# Altium project Fairing_Avionics_Interface.PrjPcb (part 2 of 2)

## Sheet STM32.SchDoc
size 558 x 431 mm; SheetNumber: 5; SheetTotal: 6; SPICEModelCachePHPYDYLM: <root> / <DocumentId>PHPYDYLM</DocumentId> / </root>
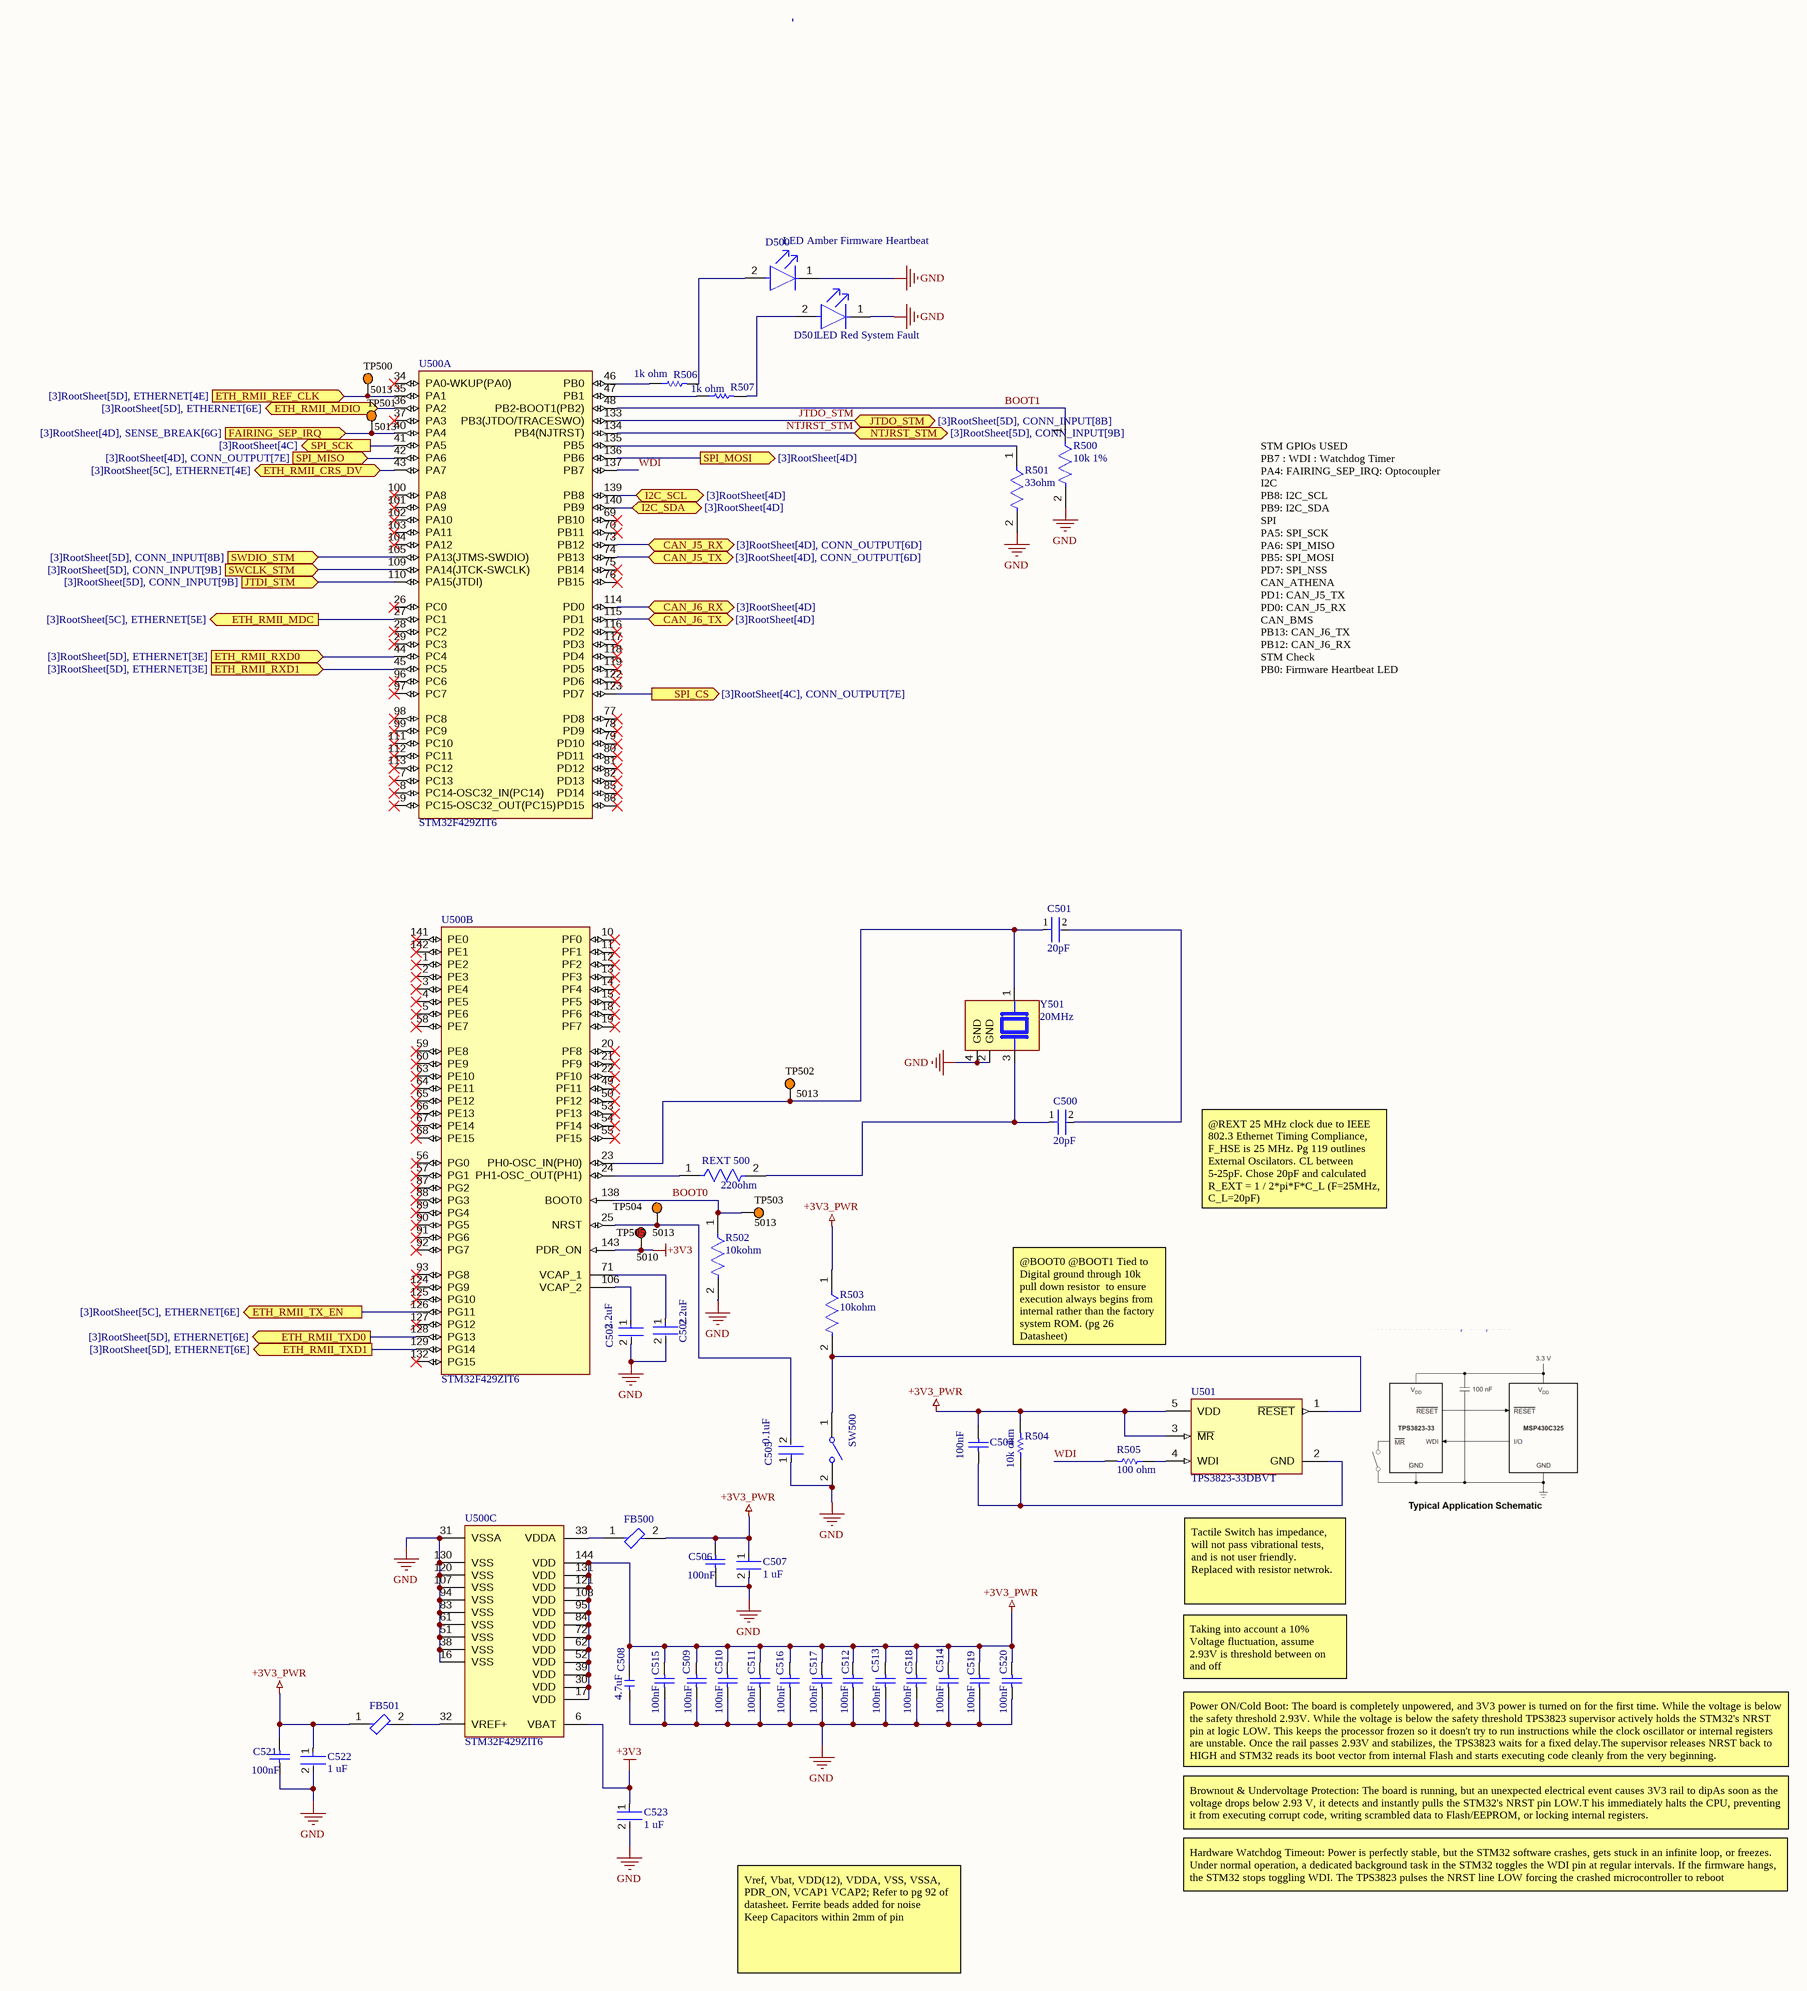
[diagram p3: STM32.SchDoc]

### Parts
C500  20pF  [FP-GJM033-0_03P-MFG]
C501  20pF  [FP-GJM033-0_03P-MFG]
C502  2.2uF  [FP-CC0603-DC-MFG]
C503  2.2uF  [FP-CC0603-DC-MFG]
C504  100nF  [CAPC1608X90X35ML10T15]
C505  0.1uF  [FP-GCM188-0_1-IPC_A]
C506  100nF  [CAPC0603(1608)100_L]
C507  1 uF  [FP-GRM15-0_1-MFG]
C508  4.7uF  [C0603]
C509  100nF  [CAPC0603(1608)100_L]
C510  100nF  [CAPC0603(1608)100_L]
C511  100nF  [CAPC0603(1608)100_L]
C512  100nF  [CAPC0603(1608)100_L]
C513  100nF  [CAPC0603(1608)100_L]
C514  100nF  [CAPC0603(1608)100_L]
C515  100nF  [CAPC0603(1608)100_L]
C516  100nF  [CAPC0603(1608)100_L]
C517  100nF  [CAPC0603(1608)100_L]
C518  100nF  [CAPC0603(1608)100_L]
C519  100nF  [CAPC0603(1608)100_L]
C520  100nF  [CAPC0603(1608)100_L]
C521  100nF  [CAPC0603(1608)100_L]
C522  1 uF  [FP-GRM15-0_1-MFG]
C523  1 uF  [FP-GRM15-0_1-MFG]
D500  LED Amber Firmware Heartbeat  [FP-SML-D12-MFG]
D501  LED Red System Fault  [FP-SML-P1-MFG]
FB500  BLM18PG121SN1D  [FP-BLM18-0_15-t0_8-IPC_A]  (value not drawn)
FB501  BLM18PG121SN1D  [FP-BLM18-0_15-t0_8-IPC_A]  (value not drawn)
R500  10k 1%  [FP-RC0603-0_55-IPC_C]
R501  33ohm  [FP-CRCW0603-e3-IPC_A]
R502  10kohm  [FP-RC0603-0_55-IPC_C]
R503  10kohm  [FP-RC0603-0_55-IPC_C]
R504  10k ohm  [RESC1609X50X30ML8T20]
R505  100 ohm  [RESC1609X50X30ML8T20]
R506  1k ohm  [RESC2010(5025)_L]
R507  1k ohm  [RESC2010(5025)_L]
REXT_500  220ohm  [FP-CRCW0603-e3-MFG]
SW500  434121050836  [434121050836]  (value not drawn)
TP500  5013  [KSTN-5013_V]
TP501  5013  [KSTN-5013_V]
TP502  5013  [KSTN-5013_V]
TP503  5013  [KSTN-5013_V]
TP504  5013  [KSTN-5013_V]
TP505  5010  [KSTN-5010_V]
U500  STM32F429ZIT6  [STM-LQFP144_L]  (parts A,B,C of 3)
U501  TPS3823-33DBVT  [FP-DBV0005A-MFG]
Y501  20MHz  [XTAL_C1E-20.000-6-3030-X-R]

### Ports
CAN_J5_RX (bidir, see [3]RootSheet[4D], CONN_OUTPUT[6D]), CAN_J5_TX (bidir, see [3]RootSheet[4D], CONN_OUTPUT[6D]), CAN_J6_RX (bidir, see [3]RootSheet[4D]), CAN_J6_TX (bidir, see [3]RootSheet[4D]), ETH_RMII_CRS_DV (bidir, see [3]RootSheet[5C], ETHERNET[4E]), ETH_RMII_MDC (out, see [3]RootSheet[5C], ETHERNET[5E]), ETH_RMII_MDIO (bidir, see [3]RootSheet[5D], ETHERNET[6E]), ETH_RMII_REF_CLK (in, see [3]RootSheet[5D], ETHERNET[4E]), ETH_RMII_RXD0 (in, see [3]RootSheet[5D], ETHERNET[3E]), ETH_RMII_RXD1 (in, see [3]RootSheet[5D], ETHERNET[3E]), ETH_RMII_TX_EN (out, see [3]RootSheet[5C], ETHERNET[6E]), ETH_RMII_TXD0 (out, see [3]RootSheet[5D], ETHERNET[6E]), ETH_RMII_TXD1 (out, see [3]RootSheet[5D], ETHERNET[6E]), FAIRING_SEP_IRQ (in, see [3]RootSheet[4D], SENSE_BREAK[6G]), I2C_SCL (bidir, see [3]RootSheet[4D]), I2C_SDA (bidir, see [3]RootSheet[4D]), JTDI_STM (in, see [3]RootSheet[5D], CONN_INPUT[9B]), JTDO_STM (bidir, see [3]RootSheet[5D], CONN_INPUT[8B]), NTJRST_STM (bidir, see [3]RootSheet[5D], CONN_INPUT[9B]), SPI_CS (out, see [3]RootSheet[4C], CONN_OUTPUT[7E]), SPI_MISO (in, see [3]RootSheet[4D], CONN_OUTPUT[7E]), SPI_MOSI (out, see [3]RootSheet[4D]), SPI_SCK (out, see [3]RootSheet[4C]), SWCLK_STM (in, see [3]RootSheet[5D], CONN_INPUT[9B]), SWDIO_STM (in, see [3]RootSheet[5D], CONN_INPUT[8B])

### Nets
+3V3: C523.1 TP505.1 U500.6(VBAT) U500.143(PDR_ON)
+3V3_PWR: C504.2 C506.2 C507.1 C508.2 C509.2 C510.2 C511.2 C512.2 C513.2 C514.2 C515.2 C516.2 C517.2 C518.2 C519.2 C520.2 C521.2 C522.1 FB500.2 FB501.1 R503.1 R504.2 U500.17(VDD) U500.30(VDD) U500.39(VDD) U500.52(VDD) U500.62(VDD) U500.72(VDD) U500.84(VDD) U500.95(VDD) U500.108(VDD) U500.121(VDD) U500.131(VDD) U500.144(VDD) U501.3(~{MR}) U501.5(VDD)
GND: C502.2 C503.2 C505.1 C506.1 C507.2 C508.1 C509.1 C510.1 C511.1 C512.1 C513.1 C514.1 C515.1 C516.1 C517.1 C518.1 C519.1 C520.1 C521.1 C522.2 C523.2 D500.1(C) D501.1(C) R500.2 R501.2 R502.2 SW500.2 U500.16(VSS) U500.31(VSSA) U500.38(VSS) U500.51(VSS) U500.61(VSS) U500.83(VSS) U500.94(VSS) U500.107(VSS) U500.120(VSS) U500.130(VSS) Y501.2(GND) Y501.4(GND)
BOOT0: R502.1 TP503.1 U500.138(BOOT0)
BOOT1: R500.1 U500.48(PB2-BOOT1(PB2))
I2C_SCL: U500.140(PB9) ; port I2C_SDA
I2C_SDA: U500.139(PB8) ; port I2C_SCL
JTDO_STM: U500.133(PB3(JTDO/TRACESWO)) ; port JTDO_STM
NTJRST_STM: U500.134(PB4(NJTRST)) ; port NTJRST_STM
WDI: R505.2 U500.137(PB7)
NetC400_2: TP501.1 U500.40(PA4) ; port FAIRING_SEP_IRQ
NetC500_1: C500.1 REXT_500.2 Y501.3
NetC500_2: C500.2 C501.2
NetC501_1: C501.1 TP502.1 U500.23(PH0-OSC_IN(PH0)) Y501.1
NetC502_1: C502.1 U500.71(VCAP_1)
NetC503_1: C503.1 U500.106(VCAP_2)
NetC504_1: C504.1 R504.1 U501.2(GND)
NetC505_2: C505.2 TP504.1 U500.25(NRST)
NetD500_2: D500.2(A) R506.2
NetD501_2: D501.2(A) R507.2
NetFB500_1: FB500.1 U500.33(VDDA)
NetFB501_2: FB501.2 U500.32(VREF+)
NetJ9_2: U500.105(PA13(JTMS-SWDIO)) ; port SWDIO_STM
NetJ9_3: U500.110(PA15(JTDI)) ; port JTDI_STM
NetJ9_5: U500.109(PA14(JTCK-SWCLK)) ; port SWCLK_STM
NetR302_1: U500.126(PG11) ; port ETH_RMII_TX_EN
NetR304_2: U500.44(PC4) ; port ETH_RMII_RXD0
NetR305_1: U500.128(PG13) ; port ETH_RMII_TXD0
NetR306_2: U500.45(PC5) ; port ETH_RMII_RXD1
NetR307_1: U500.129(PG14) ; port ETH_RMII_TXD1
NetR308_1: U500.43(PA7) ; port ETH_RMII_CRS_DV
NetR309_1: U500.36(PA2) ; port ETH_RMII_MDIO
NetR501_1: R501.1 U500.135(PB5)
NetR503_2: R503.2 SW500.1 U501.1(~{RESET})
NetR505_1: R505.1 U501.4(WDI)
NetR506_1: R506.1 U500.46(PB0)
NetR507_1: R507.1 U500.47(PB1)
NetR602_1: U500.136(PB6) ; port SPI_MOSI
NetR603_1: U500.42(PA6) ; port SPI_MISO
NetR604_1: U500.41(PA5) ; port SPI_SCK
NetR605_1: U500.123(PD7) ; port SPI_CS
NetREXT_500_1: REXT_500.1 U500.24(PH1-OSC_OUT(PH1))
NetTP500_1: TP500.1 U500.35(PA1) ; port ETH_RMII_REF_CLK
NetU300_11: U500.27(PC1) ; port ETH_RMII_MDC
NetU500_73: U500.73(PB12) ; port CAN_J5_RX
NetU500_74: U500.74(PB13) ; port CAN_J5_TX
NetU500_114: U500.114(PD0) ; port CAN_J6_RX
NetU500_115: U500.115(PD1) ; port CAN_J6_TX

Not connected (* = marked no-connect by the designer): U500 1(PE2)* 2(PE3)* 3(PE4)* 4(PE5)* 5(PE6)* 7(PC13)* 8(PC14-OSC32_IN(PC14))* 9(PC15-OSC32_OUT(PC15))* 10(PF0)* 11(PF1)* 12(PF2)* 13(PF3)* 14(PF4)* 15(PF5)* 18(PF6)* 19(PF7)* 20(PF8)* 21(PF9)* 22(PF10)* 26(PC0)* 28(PC2)* 29(PC3)* 34(PA0-WKUP(PA0))* 37(PA3)* 49(PF11)* 50(PF12)* 53(PF13)* 54(PF14)* 55(PF15)* 56(PG0)* 57(PG1)* 58(PE7)* 59(PE8)* 60(PE9)* 63(PE10)* 64(PE11)* 65(PE12)* 66(PE13)* 67(PE14)* 68(PE15)* 69(PB10)* 70(PB11)* 75(PB14)* 76(PB15)* 77(PD8)* 78(PD9)* 79(PD10)* 80(PD11)* 81(PD12)* 82(PD13)* 85(PD14)* 86(PD15)* 87(PG2)* 88(PG3)* 89(PG4)* 90(PG5)* 91(PG6)* 92(PG7)* 93(PG8)* 96(PC6)* 97(PC7)* 98(PC8)* 99(PC9)* 100(PA8)* 101(PA9)* 102(PA10)* 103(PA11)* 104(PA12)* 111(PC10)* 112(PC11)* 113(PC12)* 116(PD2)* 117(PD3)* 118(PD4)* 119(PD5)* 122(PD6)* 124(PG9)* 125(PG10)* 127(PG12)* 132(PG15)* 141(PE0)* 142(PE1)*

### Notes on the sheet
- STM GPIOs USED
  PB7 : WDI : Watchdog Timer
  PA4: FAIRING_SEP_IRQ: Optocoupler
  I2C
  PB8: I2C_SCL
  PB9: I2C_SDA
  SPI
  PA5: SPI_SCK
  PA6: SPI_MISO
  PB5: SPI_MOSI
  PD7: SPI_NSS
  CAN_ATHENA
  PD1: CAN_J5_TX
  PD0: CAN_J5_RX
  CAN_BMS
  PB13: CAN_J6_TX
  PB12: CAN_J6_RX
  STM Check
  PB0: Firmware Heartbeat LED
- @REXT 25 MHz clock due to IEEE 802.3 Ethernet Timing Compliance, F_HSE is 25 MHz. Pg 119 outlines External Oscilators. CL between 5-25pF. Chose 20pF and calculated R_EXT = 1 / 2*pi*F*C_L (F=25MHz, C_L=20pF)
- @BOOT0 @BOOT1 Tied to Digital ground through 10k pull down resistor  to ensure execution always begins from internal rather than the factory system ROM. (pg 26 Datasheet)
- Tactile Switch has impedance, will not pass vibrational tests, and is not user friendly. Replaced with resistor netwrok.
- Taking into account a 10% Voltage fluctuation, assume 2.93V is threshold between on and off
- Power ON/Cold Boot: The board is completely unpowered, and 3V3 power is turned on for the first time. While the voltage is below the safety threshold 2.93V. While the voltage is below the safety threshold TPS3823 supervisor actively holds the STM32's NRST pin at logic LOW. This keeps the processor frozen so it doesn't try to run instructions while the clock oscillator or internal registers are unstable. Once the rail passes 2.93V and stabilizes, the TPS3823 waits for a fixed delay.The supervisor releases NRST back to HIGH and STM32 reads its boot vector from internal Flash and starts executing code cleanly from the very beginning.
- Brownout & Undervoltage Protection: The board is running, but an unexpected electrical event causes 3V3 rail to dipAs soon as the voltage drops below 2.93 V, it detects and instantly pulls the STM32's NRST pin LOW.T his immediately halts the CPU, preventing it from executing corrupt code, writing scrambled data to Flash/EEPROM, or locking internal registers.
- Hardware Watchdog Timeout: Power is perfectly stable, but the STM32 software crashes, gets stuck in an infinite loop, or freezes. Under normal operation, a dedicated background task in the STM32 toggles the WDI pin at regular intervals. If the firmware hangs, the STM32 stops toggling WDI. The TPS3823 pulses the NRST line LOW forcing the crashed microcontroller to reboot
- Vref, Vbat, VDD(12), VDDA, VSS, VSSA, PDR_ON, VCAP1 VCAP2; Refer to pg 92 of datasheet. Ferrite beads added for noise
  Keep Capacitors within 2mm of pin
- DWG. NO.
- REV.
- SHT.
- REVISION
- DESCRIPTION
- DATE
- APPROVED
- THIS DOCUMENT AND THE DATA DISCLOSED HEREIN OR HEREWITH IS THE PROPERTY OF ALTIUM LIMITED AND MAY BE FREELY DISTRIBUTED IN WHOLE. NO RIGHTS ARE RESERVED OR EXPRESS OR IMPLIED WARANTEE GIVEN.
- ENG:
- DSN:
- APPROVALS
- PROJECT
- DOCUMENT REVISION:
- DESIGN ITEM:
- CHK:
- BOM:
- REFERENCE DOCUMENTS
- PROJECT REVISION:
- TITLE
- FAB DWG:
- PCB DWG:
- ASSY DWG:
- SCALE:
- SIZE
- C
- CAGE CODE
- FILE NAME
- DWG NO.
- SHEET
- OF
- REV

### Library data of the parts
C500 C501 = CMP-00260-148574905-1: GJM0335C2A200GB01D Gjm 0201 C0G 20PF 100V 2%; Voltage Rating (DC): 100V; Case/Package: 0201; NexarPartId: 148574905; Thickness: 300µm; Lifecycle Status: Production; Length: 600µm; Width: 300µm; Capacitance: 20pF
C502 C503 = CMP-03422-000578-2: CAP CER 2.2UF 50V X5R 0603; Tolerance: 10%; Packaging: Cut Tape; Capacitance: 2.2uF; Min Operating Temperature: -55°C; RoHS Compliant: Yes; Max Operating Temperature: 85°C; Case Code (Metric): 1608; Voltage Rating: 50V; Case/Package: 0603; Case Code (Imperial): 0603; Mount: Surface Mount
C504 = CMP-2006-02375-5: Chip Capacitor, 100 nF, +/- 10%, 50 V, -55 to 125 degC, 0603 (1608 Metric), RoHS, Tape and Reel; Manufacturer: Murata; Voltage Rating: 50 V; Min Operating Temperature: -55 degC; ComponentLink1URL: http://www.murata.com/; PackageReference: 0603; Max Operating Temperature: 125 degC; ComponentLink1Description: Manufacturer URL; ComponentLink2Description: Datasheet; Packaging: Tape and Reel; PackageDescription: 2-Pin Surface Mount Device, Body 1.6 x 0.8 mm; Height: 0.8 mm; Mounting Technology: Surface Mount; Mount: Surface Mount; Length: 1.6 mm; ComponentLink2URL: http://psearch.en.murata.com/capacitor/product/GCM188R71H104KA57%23.pdf; Package Quantity: 4000; REACH SVHC: No SVHC; RoHSCompliant: true; DatasheetVersion: 07/2016
C505 = CMP-2006-02355-2: CAP CER 0.1UF 16V X7R 0603; Tolerance: 10%; Capacitance: 100nF; Thickness: 0.035inch; Lead Free: Lead Free; Dielectric: X7R; Case Code (Metric): 1608; Voltage Rating: 16V; Depth: 0.8mm; Height: 0.8mm; RoHS Compliant: Yes; Termination: SMD/SMT; Case/Package: 0603; Case Code (Imperial): 0603; Package Quantity: 4000; Voltage: 16V; Radiation Hardening: No; Series: GCM; Length: 1.6mm; Mount: Surface Mount; Construction: Flat; Ratings: AEC-Q200; Min Operating Temperature: -55°C; Packaging: Tape and Reel; Voltage Rating (DC): 16V; Max Operating Temperature: 125°C; Width: 0.031inch; REACH SVHC: No SVHC
C506 C509-C521 = CMP-1035-02591-1: CAP 100nF 50V ±5% 0603 (1608 Metric) Thickness 1mm SMD; Tolerance: Â±5%; Case-Metric: 1608; Case-EIA: 0603; Rated Voltage: 50 V; Max Thickness: 1 mm; Technology: SMT; Value: 100nF
C507 C522 C523 = CMP-2008-04556-2: CAP CER 1UF 10V X5R 0402; Manufacturer Part Number: GRM155R61A105KE15D; Manufacturer: Murata; Material: Ceramic; Tolerance: 10%; Temperature Coefficient: 15%; Octopart: https://octopart.com/grm155r61a105ke15d-murata-197442; Lead Free: Yes; ComponentLink2Description: Datasheet; Temperature: -55°C to +85°C; Temperature Range High: +85°C; Height: 0.55mm; Capacitance: 1uF; Ipc Land Pattern Name: CAPC10050X50; ComponentLink2URL: https://search.murata.co.jp/Ceramy/image/img/A01X/G101/ENG/GRM155R61A105KE15-01A.pdf; Temperature Range Low: -55°C; Device Class L2: Capacitors; Voltage Rating: 10V; RoHS: TRUE; Device Class L1: Passive Components; Device Class L3: Ceramic Capacitors; Temperature Characteristic: X5R; Mouser Description: 0402 1 uF 10 V ±10% Tolerance X5R Surface Mount Multilayer Ceramic Capacitor; Automotive: No; Package: GRM15-0.1; Digikey Description: CAP CER 1UF 10V X5R 0402; Value: 1uF; Category: Cap
C508 = CERAMIC-4.7UF-10V-10%-X5R(0603): 4.7 ÂµF Â±10% 10V Ceramic Capacitor X5R 0603 (1608 Metric); MF: Yageo; MP: CC0603KRX5R6BB475; SnapEDA_Link: https://www.snapeda.com/parts/CC0603KRX5R6BB475/Yageo/view-part/?ref=snap; Package: 0603 Yageo; Value: *; Check_prices: https://www.snapeda.com/parts/CC0603KRX5R6BB475/Yageo/view-part/?ref=eda
D500 = CMP-08952-000023-1: LED YELLOW DIFFUSED 0603 SMD; Manufacturer: Rohm; Manufacturer Part Number: SML-D12Y8WT86; Forward Voltage: 2.2V; Wavelength: 590nm; Reverse Voltage: 5V; Led Orientation: Top View; Forward Current: 20mA; Power Dissipation: 54mW; Luminous Intensity: 63mcd; Temperature: -40°C to +85°C; Package: SML-D12; Height: 0.65mm; Lead Free: Yes; Octopart: https://octopart.com/sml-d12y8wt86-rohm-8992279; Device Class L3: unset; Category: Diode; Device Class L2: LEDs; Temperature Range Low: -40°C; Colour: Yellow; ComponentLink2URL: https://d1d2qsbl8m0m72.cloudfront.net/en/products/databook/datasheet/opto/led/chip_mono/sml-d12x8_d13x8-e.pdf; Automotive: No; Device Class L1: Optoelectronics; Digikey Description: LED YELLOW DIFFUSED 0603 SMD; Mouser Description: Standard LEDs - SMD SMD Yellow 25-160 mcd; RoHS: TRUE; Temperature Range High: +85°C; ComponentLink2Description: Datasheet
D501 = CMP-08952-000003-1: LED RED CLEAR 1006 SMD; Manufacturer Part Number: SML-P11VTT86R; Manufacturer: Rohm; Led Orientation: Top View; Power Dissipation: 50mW; Wavelength: 626nm; Forward Voltage: 1.8V; Forward Current: 1mA; Luminous Intensity: 4mcd; Reverse Voltage: 5V; ComponentLink2URL: https://www.rohm.com/datasheet/SML-P11VT(R)/sml-p11-e; Temperature: -40°C to +85°C; Device Class L2: LEDs; Package: SML-P1; Category: Diode; Automotive: No; RoHS: TRUE; Lead Free: Yes; Digikey Description: LED RED CLEAR 1006 SMD; Device Class L3: unset; ComponentLink2Description: Datasheet; Octopart: https://octopart.com/sml-p11vtt86r-rohm-34112314; Device Class L1: Optoelectronics; Temperature Range High: +85°C; Temperature Range Low: -40°C; Mouser Description: SML-P11 Series Red 0402 Clear 4 mcd 1.8 V Surface Mount PICOLED? LED; Height: 0.25mm; Colour: Red
FB500 FB501 = CMP-0686-00557-7: Chip Ferrite Bead, 0603, 120Ω @ 100MHz, 0.05Ω, 25%, 2A; Impedance: 120R; Number of Circuits: 1; Shielding: Unshielded; Material: Steel; DC Resistance (DCR): 50mR; Case Code (Imperial): 0603; RoHS Compliant: Yes; Number of Pins: 2; Min Operating Temperature: -55°C; Case Code (Metric): 1608; Frequency: 100MHz; Length: 1.6mm; Test Frequency: 100MHz; Max Operating Temperature: 125°C; Packaging: Tape and Reel; Max Current Rating: 2A; Termination: SMD/SMT; Lead Free: Lead Free; Max DC Current: 2A; Case/Package: 0603; Height: 0.8mm; Current Rating: 2A; Radiation Hardening: No; Core Material: Ferrite; DC Current: 2A; REACH SVHC: No SVHC; Package Quantity: 1; Depth: 0.8mm; Number of Lines: 1; Tolerance: 25%; Width: 0.8mm
R500 R502 R503 = CMP-2100-03664-2: RES 10K OHM 1% 1/10W 0603; Voltage Rating: 75V; Voltage Rating (DC): 50V; Resistance: 10kR; Power Rating: 100mW; Temperature Coefficient: 100ppm/°C; Depth: 0.8mm; Termination: SMD/SMT; Resistor Type: Thick Film; Series: RC; Construction: Rectangular; Features: Moisture Resistant; Packaging: Tape and Reel; Min Operating Temperature: -55°C; Number of Terminations: 2; Lead Pitch: 0.3mm; RoHS Compliant: Yes; Case/Package: 0603; Resistance Tolerance: 1%; Military Standard: Not; Weight: 7.1E-05oz; Number of Pins: 2; Tolerance: 1%; Length: 1.6mm; Case Code (Imperial): 0603; Lead Free: Lead Free; Width: 0.8mm; Max Power Dissipation: 100mW; Height: 0.45mm; Max Operating Temperature: 155°C; Case Code (Metric): 1608; Size Code: 0603
R501 = CMP-2000-03250-2: RES Thick Film, 33Ω, 1%, 0.1W, 100ppm/°C, 0603; Voltage Rating: 75V; Max Power Dissipation: 100mW; Resistance: 33R; Case/Package: 0603; Weight: 7.1E-05oz; Termination: SMD/SMT; Voltage Rating (DC): 75V; Packaging: Tape and Reel; Width: 0.85mm; Depth: 0.85mm; Mount: Surface Mount; Number of Terminations: 2; Min Operating Temperature: -55°C; Military Standard: Not; Package Quantity: 10; Contact Plating: Tin; Radiation Hardening: No; Lead Free: Lead Free; Tolerance: 1%; Power Rating: 100mW; Features: Automotive AEC-Q200; Height: 0.45mm; Case Code (Metric): 1608; Length: 1.55mm; Composition: Thick Film; Max Operating Temperature: 155°C; Temperature Coefficient: 100ppm/°C; Case Code (Imperial): 0603
R504 R505 = CMP-2000-03824-5: Chip Resistor, 100 Ohm, +/- 1%, 100 mW,-55 to 155 degC, 0603 (1608 Metric), RoHS, Tape and Ree; Manufacturer: Vishay Semiconductor; ComponentLink2URL: http://www.vishay.com/docs/20035/dcrcwe3.pdf; ComponentLink1URL: http://www.vishay.com/; Mounting Technology: Surface Mount; ComponentLink1Description: Manufacturer URL; ComponentLink2Description: Datasheet; PackageDescription: 2-Pin Surface Mount Device, Body 1.575 x 0.85 mm; PackageReference: 0603; DatasheetVersion: 06/2012
R506 R507 = CMP-1017-00074-1: 1K 0.75W 5% 2010 (5025 Metric)  SMD; Case-EIA: 2010; Value: 1000.00 Ohm; Case-Metric: 5025; Technology: SMT; Tolerance: 5 %; Power: 0.75 W
REXT_500 = CMP-2000-03085-2: RES Thick Film, 220Ω, 1%, 0.1W, 100ppm/°C, 0603; Power Rating: 100mW; Voltage Rating: 75V; Resistance: 220R; Contact Plating: Tin; Package Quantity: 10; Lead Free: Lead Free; Packaging: Tape and Reel; Max Operating Temperature: 155°C; Case/Package: 0603; Radiation Hardening: No; Height: 0.45mm; Width: 0.033inch; Case Code (Imperial): 0603; Number of Terminations: 2; Tolerance: 1%; Min Operating Temperature: -55°C; Termination: SMD/SMT; Length: 1.55mm; Features: Automotive AEC-Q200; Voltage Rating (DC): 75V; Case Code (Metric): 1608; Composition: Thick Film; Military Standard: Not; Temperature Coefficient: 100ppm/°C; Depth: 0.85mm; Weight: 7.1E-05oz; Max Power Dissipation: 100mW
SW500 = CMP-1459-00008-7: Tactile Switch, 0.05A, 12Vdc, 360Gf, Smd;; Manufacturer Lifecycle Status: ACTIVE; Current Rating: 50mA; Switch Function: Off-Mom; Switch Travel: 250µm; Illumination Type: Non-Illuminated; Throw Configuration: SPST; Actuator Material: Liquid Crystal Polymer, Polymer; Voltage Rating: 12V; Mechanical Life: 50kcycles; YEOL: 1 = Estimated lifetime > 10 years; Insulation Resistance: 100MΩ; Termination: SMD/SMT; RoHS: Compliant; Height: 5mm; Contact Plating: Silver; Max Operating Temperature: 85°C; Min Operating Temperature: -40°C; Packaging: Tape and Reel; Lifecycle Status: Production
TP500-TP504 = CMP-1672-00005-4: Test Point, Orange, Through Hole, RoHS, Bulk; Manufacturer: Keystone; REACH SVHC: No SVHC; ComponentLink2Description: Datasheet; PackageDescription: 1-Pin Through Hole Device, Dia 3.17 mm; Package Quantity: 100; PackageReference: 5013; Contact Material: Bronze; DatasheetVersion: Rev. F, 12/2013; ComponentLink2URL: http://www.keyelco.com/product-pdf.cfm?p=1322; Contact Plating: Silver; ComponentLink1URL: http://www.keyelco.com/; Packaging: Bulk; ComponentLink1Description: Manufacturer URL; Colour: Orange; Height: 8.12 mm; RoHSCompliant: True; Mount: Through Hole; Mounting Technology: Through Hole
TP505 = CMP-1672-00002-4: Test Point, Red, Through Hole, RoHS, Bulk; Manufacturer: Keystone; Contact Material: Bronze; Mounting Technology: Through Hole; RoHSCompliant: true; Pins: 1; Package Quantity: 100; ComponentLink2Description: Datasheet; Height: 8.12 mm; ComponentLink1URL: http://www.keyelco.com/; DatasheetVersion: Rev. F, 12/2013; Mount: Through Hole; PackageReference: 5010; Contact Plating: Silver; Packaging: Bulk; Colour: Red; REACH SVHC: No SVHC; PackageDescription: 1-Pin Through Hole Device, Dia 3.17 mm; ComponentLink2URL: http://www.keyelco.com/product-pdf.cfm?p=1319; ComponentLink1Description: Manufacturer URL
U500 = CMP-0243-00051-2: ARM Cortex-M4 32-bit MCU+FPU, 225 DMIPS, 2048 kB Flash, 256 kB Internal RAM, 114 I/Os, 144-pin LQFP, -40 to 85 degC, Tray; Manufacturer: STMicroelectronics; I/Os (High Current): 114; Supply Voltage(Vcc) min (V): 1.8; Internal RAM Size (kB): 256; Supply Voltage(Vcc) max (V): 3.6; Operating Frequency(F) (Processor speed) (MHz): 180; D/A Converter: 2x12-bit; FLASH Size (Prog) (kB): 2048; DatasheetVersion: Rev. 2; PackageReference: LQFP144; ComponentLink2URL: http://www.st.com/st-web-ui/static/active/en/resource/technical/document/data_brief/DM00053488.pdf; PartNumber: STM32F429ZIT6; PackageVersion: Rev. 4, 06/2013; ComponentLink3URL: http://www.st.com/st-web-ui/static/active/en/resource/technical/document/datasheet/DM00037051.pdf; Packing: Tray; Mounting Technology: Surface Mount; ComponentLink3Description: Package Specification; ComponentLink1Description: Manufacturer URL; Core: ARM Cortex-M4; ComponentLink1URL: http://www.st.com/web/en/home.html; ComponentLink2Description: Datasheet; PackageDescription: 144-Pin Low Profile Quad Flat Package, 20 x 20 mm Body, 0.5 mm Pitch
U501 = CMP-04919-000008-1: IC SUPERVISOR 1 CHANNEL SOT23-5; Manufacturer: Texas Instruments; Watchdog Timer: true; Threshold Voltage: 2.93V; Reset Timeout: 200ms; Max Supply Voltage: 5.5V; Min Supply Voltage: 1.1V; Reset Type: Active Low; Number Of Outputs: 1; Nominal Supply Current: 15uA; Standoff Height: 0mm; Output Current: -400uA; Digikey Description: IC SUPERVISOR 1 CHANNEL SOT23-5; Temperature Range Low: -40°C; Automotive: No; Category: IC; Mouser Description: Supervisory Circuits w/ Watchdog; Lead Free: Yes; Manufacturer Part Number: TPS3823-33DBVT; Device Class L2: Power Management ICs; Ambient Temperature Range Low: -40°C; ComponentLink2Description: Datasheet; Device Class L3: Voltage Supervisors; Ambient Temperature Range High: +85°C; Temperature Range High: +85°C; ComponentLink2URL: http://www.ti.com/lit/ds/symlink/tps3823.pdf; Octopart: https://octopart.com/tps3823-33dbvt-texas+instruments-875682; Temperature: -40°C to +85°C; Package: DBV0005A; Device Class L1: Integrated Circuits (ICs); RoHS: TRUE; Number Of Rails Monitored: 1; Height: 1.45mm
Y501 = C1E-20.000-6-3030-X-R: Package: None; Price: None; Value: *; MP: C1E-20.000-6-3030-X-R; Availability: Unavailable

## Sheet SENSE_BREAK.SchDoc
size 558 x 431 mm; SheetNumber: 4; SheetTotal: 6
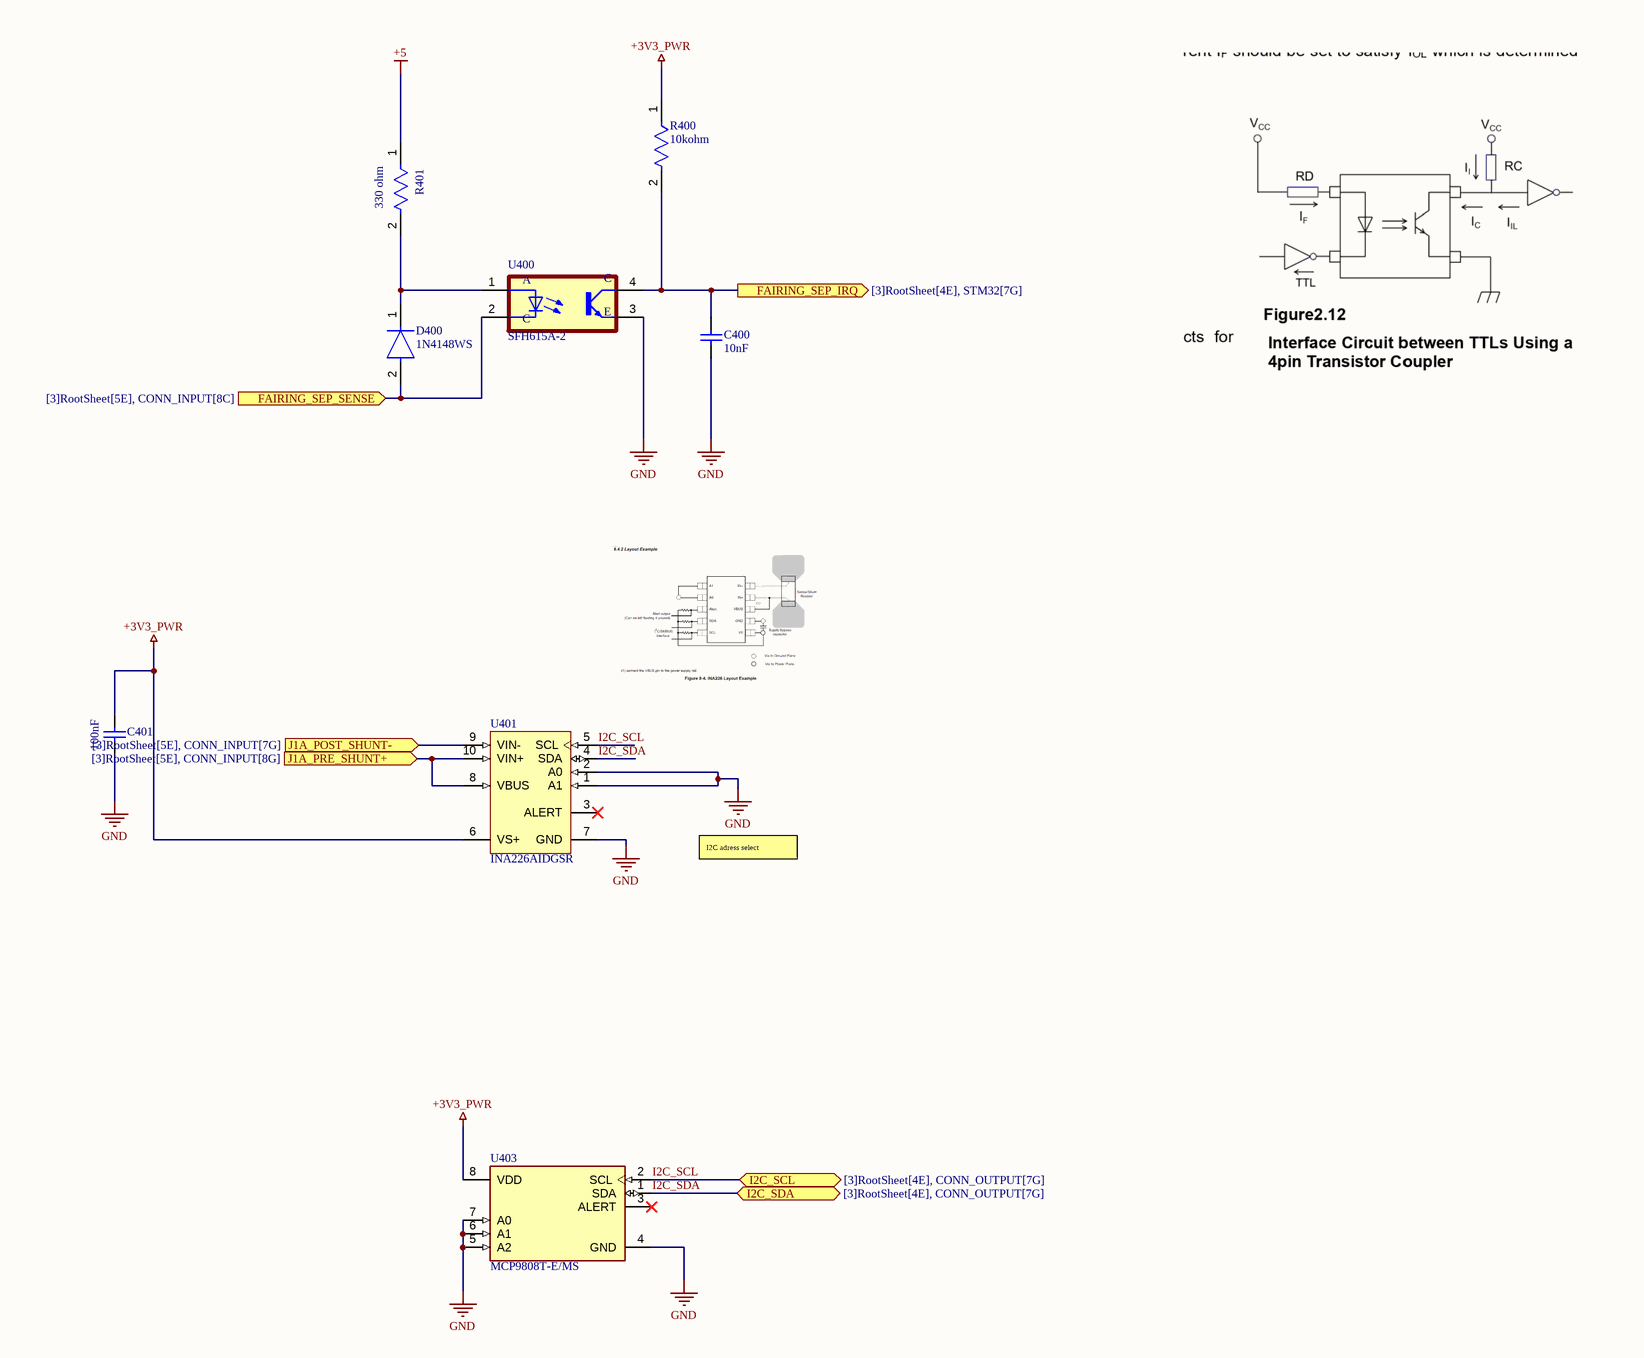
[diagram p4: SENSE_BREAK.SchDoc]

### Parts
C400  10nF  [CAPC1608X90X35LL10T15]
C401  100nF  [CAPC1608X90X35ML10T15]
D400  1N4148WS  [FP-477AB-IPC_C]
R400  10kohm  [FP-RC0603-0_55-IPC_C]
R401  330 ohm  [FP-CRCW0805-e3-MFG]
U400  SFH615A-2  [DIP762W50P254L458H480Q4]
U401  INA226AIDGSR  [DGS0010A_L]
U403  MCP9808T-E/MS  [FP-C04-111-MFG]

### Ports
FAIRING_SEP_IRQ (out, see [3]RootSheet[4E], STM32[7G]), FAIRING_SEP_SENSE (in, see [3]RootSheet[5E], CONN_INPUT[8C]), I2C_SCL (bidir, see [3]RootSheet[4E], CONN_OUTPUT[7G]), I2C_SDA (bidir, see [3]RootSheet[4E], CONN_OUTPUT[7G]), J1A_POST_SHUNT- (in, see [3]RootSheet[5E], CONN_INPUT[7G]), J1A_PRE_SHUNT+ (in, see [3]RootSheet[5E], CONN_INPUT[8G])

### Nets
+3V3_PWR: C401.2 R400.1 U401.6(VS+) U403.8(VDD)
+5: R401.1
GND: C400.1 C401.1 U400.3(E) U401.1(A1) U401.2(A0) U401.7(GND) U403.4(GND) U403.5(A2) U403.6(A1) U403.7(A0)
I2C_SCL: U401.5(SCL) U403.2(SCL) ; port I2C_SCL
I2C_SDA: U401.4(SDA) U403.1(SDA) ; port I2C_SDA
NetC100_2: U401.8(VBUS) U401.10(VIN+) ; port J1A_PRE_SHUNT+
NetC400_2: C400.2 R400.2 U400.4(CO) ; port FAIRING_SEP_IRQ
NetD101_2: D400.2(A) U400.2(C) ; port FAIRING_SEP_SENSE
NetD400_1: D400.1(C) R401.2 U400.1(A)
NetFB100_1: U401.9(VIN-) ; port J1A_POST_SHUNT-

Not connected (* = marked no-connect by the designer): U401 3(ALERT)*; U403 3(ALERT)*

### Notes on the sheet
- I2C adress select
- DWG. NO.
- REV.
- SHT.
- REVISION
- DESCRIPTION
- DATE
- APPROVED
- THIS DOCUMENT AND THE DATA DISCLOSED HEREIN OR HEREWITH IS THE PROPERTY OF ALTIUM LIMITED AND MAY BE FREELY DISTRIBUTED IN WHOLE. NO RIGHTS ARE RESERVED OR EXPRESS OR IMPLIED WARANTEE GIVEN.
- ENG:
- DSN:
- APPROVALS
- PROJECT
- DOCUMENT REVISION:
- DESIGN ITEM:
- CHK:
- BOM:
- REFERENCE DOCUMENTS
- PROJECT REVISION:
- TITLE
- FAB DWG:
- PCB DWG:
- ASSY DWG:
- SCALE:
- SIZE
- C
- CAGE CODE
- FILE NAME
- DWG NO.
- SHEET
- OF
- REV

### Library data of the parts
C400 = CMP-2006-02373-1: Part Number: GCM188R71H103KA37D; Manufacturer: Murata
C401 = CMP-2006-02375-5: as C504 on sheet STM32; Min Operating Temperature: -55 degC; ComponentLink1URL: http://www.murata.com/; PackageReference: 0603; Max Operating Temperature: 125 degC; ComponentLink1Description: Manufacturer URL; ComponentLink2Description: Datasheet; Packaging: Tape and Reel; PackageDescription: 2-Pin Surface Mount Device, Body 1.6 x 0.8 mm; Height: 0.8 mm; Mounting Technology: Surface Mount; Mount: Surface Mount; Length: 1.6 mm; ComponentLink2URL: http://psearch.en.murata.com/capacitor/product/GCM188R71H104KA57%23.pdf; Package Quantity: 4000; REACH SVHC: No SVHC; RoHSCompliant: true; DatasheetVersion: 07/2016
D400 = CMP-07163-000040-1: DIODE GEN PURP 75V 150MA SOD323F; Forward Voltage: 1V; Power Dissipation: 200mW; Element Configuration: Single; Max Forward Surge Current (Ifsm): 2A; Peak Reverse Current: 5uA; Recovery Time: 4ns; Package Quantity: 1; Number of Pins: 2; Height: 1mm; REACH SVHC: No SVHC; Max Reverse Voltage (DC): 75V; Forward Current: 150mA; Length: 1.8mm; Max Repetitive Reverse Voltage (Vrrm): 75V; Max Operating Temperature: 150°C; Average Rectified Current: 150mA; Contact Plating: Tin; Packaging: Tape and Reel; Radiation Hardening: No; Min Operating Temperature: -55°C; Width: 1.35mm; Weight: 0.0276g; Lead Free: Lead Free; Mount: Surface Mount; Reverse Voltage: 75V; Reverse Recovery Time: 4ns
R400 = CMP-2100-03664-2: as R500 on sheet STM32; Depth: 0.8mm; Termination: SMD/SMT; Resistor Type: Thick Film; Series: RC; Construction: Rectangular; Features: Moisture Resistant; Packaging: Tape and Reel; Min Operating Temperature: -55°C; Number of Terminations: 2; Lead Pitch: 0.3mm; RoHS Compliant: Yes; Case/Package: 0603; Resistance Tolerance: 1%; Military Standard: Not; Weight: 7.1E-05oz; Number of Pins: 2; Tolerance: 1%; Length: 1.6mm; Case Code (Imperial): 0603; Lead Free: Lead Free; Width: 0.8mm; Max Power Dissipation: 100mW; Height: 0.45mm; Max Operating Temperature: 155°C; Case Code (Metric): 1608; Size Code: 0603
R401 = CMP-2001-03823-2: RES Thick Film, 330Ω, 1%, 0.125W, 100ppm/°C, 0805; Voltage Rating (DC): 150V; Resistance: 330R; Max Power Dissipation: 125mW; Mount: Surface Mount; Packaging: Tape and Reel; Min Operating Temperature: -55°C; Military Standard: Not; Case Code (Metric): 2012; Height: 0.02inch; Voltage Rating: 150V; Case/Package: 0805; Max Operating Temperature: 155°C; Width: 0.049inch; Case Code (Imperial): 0805; Termination: SMD/SMT; Lead Free: Lead Free; Contact Plating: Tin; Package Quantity: 10; Composition: Thick Film; Length: 2mm; Features: Automotive AEC-Q200; Depth: 1.25mm; Weight: 0.000194oz; Tolerance: 1%; Power Rating: 125mW; Number of Terminations: 2; Temperature Coefficient: 100ppm/°C
U400 = SFH615A-2: Optocoupler, 1.25 V (Typ.), 60 mA (Max.), 5300 V (RMS) (Max.), 100 mW (Max.) | Vishay / Small Signal & Opto Products (SSP) SFH615A-2; MF: Vishay Semiconductor; SnapEDA_Link: https://www.snapeda.com/parts/SFH615A-2/Vishay/view-part/?ref=snap; Package: DIP-4 Vishay; Value: *; MP: SFH615A-2; Check_prices: https://www.snapeda.com/parts/SFH615A-2/Vishay/view-part/?ref=eda
U401 = CMP-0704-00058-2: High-Side Measurement, Bi-Directional Current / Power Monitor with I2C Interface, 2.7 to 5.5 V, -40 to 125 degC, 10-pin SOP (DGS10), Green (RoHS & no Sb/Br); Vs(Max)(V): 5.5; CMRR(Min)(dB): 126; Rating: Catalog; Input Offset (+/-)(Max)(uV): 10; Small-Signal Bandwidth(Typ)(MHz): 0.007; Input Offset Drift (+/-)(Max)(uV/Degrees Celsius): 0.1; Common Mode Range(Max)(V): 36; Gain(V/V): 1; SubFamily: Current Shunt Monitor; Quiescent Current (+/-)(Typ)(mA): 0.33; Vs(Min)(V): 2.7; Common Mode Range(Min)(V): 0; ComponentLink2URL: http://www.ti.com/general/docs/lit/getliterature.tsp?genericPartNumber=INA226&fileType=pdf; ComponentLink1URL: http://www.ti.com/; PartNumber: INA226AIDGSR; Mounting Technology: Surface Mount; PackageDescription: 10-Pin Plastic Small Outline, Body 3 x 3 mm, Pitch 0.5 mm; ComponentLink3Description: Package Specification; Code_JEDEC: MO-153; Eco-Plan: Green (RoHS & no Sb/Br); PackageReference: DGS0010A; ComponentLink2Description: Datasheet; ComponentLink3URL: http://www.ti.com/lit/ml/mpds035b/mpds035b.pdf; ComponentLink1Description: Manufacturer URL; DatasheetVersion: SBOS547; PackageVersion: 4073272/C, 02/2004
U403 = CMP-0192-00343-2: SENSOR DIGITAL -40C-125C 8MSOP; Interface: I2C; Operating Supply Current: 200uA; Resolution: 10b; Min Supply Voltage: 2.7V; Max Supply Voltage (DC): 5.5V; Width: 3mm; Height: 0.95mm; Package Quantity: 2500; Length: 3mm; Lead Free: Lead Free; Radiation Hardening: No; Number of Pins: 8; Min Supply Voltage (DC): 2.7V; Output Type: Digital; Packaging: Tape and Reel; Max Supply Voltage: 5.5V; Max Operating Temperature: 125°C; Case/Package: MSOP; Min Operating Temperature: -40°C

## Sheet CONN_OUTPUT.SchDoc
size 558 x 431 mm; SheetNumber: 6; SheetTotal: 6
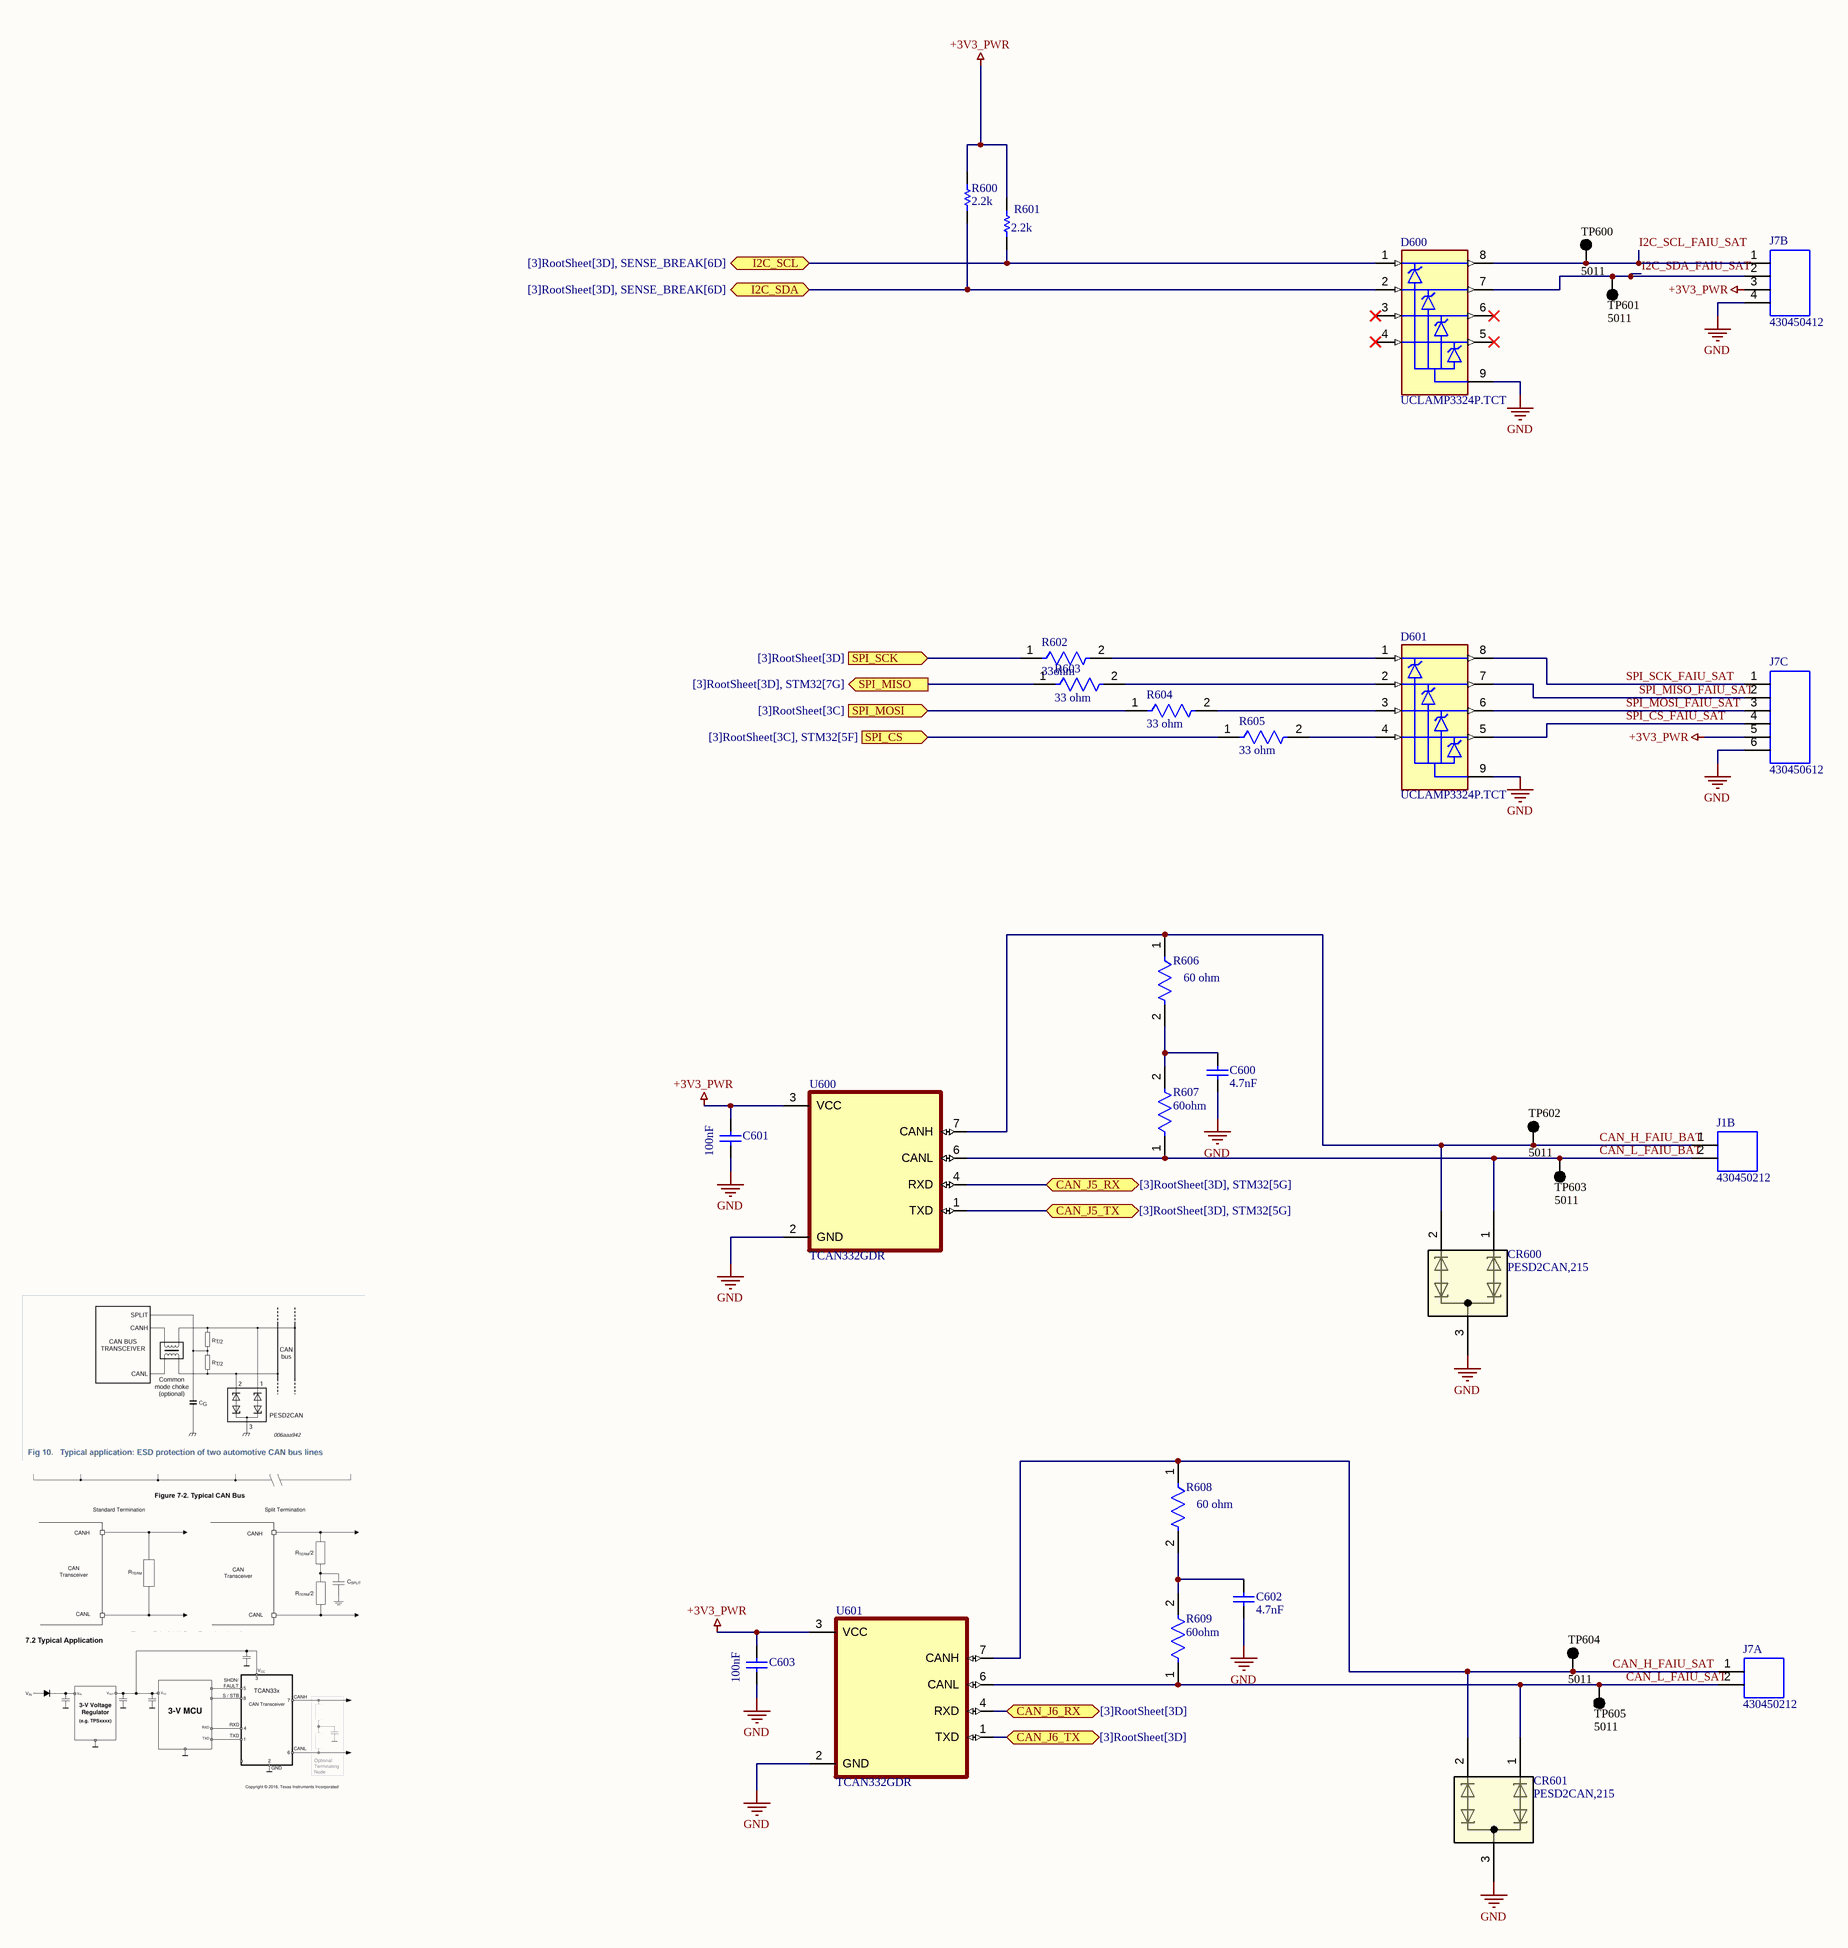
[diagram p5: CONN_OUTPUT.SchDoc]

### Parts
C600  4.7nF  [CAPC1608X90X35LL10T15]
C601  100nF  [CAPC1608X90X35LL10T15]
C602  4.7nF  [CAPC1608X90X35LL10T15]
C603  100nF  [CAPC1608X90X35LL10T15]
CR600  PESD2CAN,215  [SOT23_TO-236AB_NEX]
CR601  PESD2CAN,215  [SOT23_TO-236AB_NEX]
D600  UCLAMP3324P.TCT  [SON50P210X160X65-9N]
D601  UCLAMP3324P.TCT  [SON50P210X160X65-9N]
J1B  430450212  [CONN_SD-43045-005_02_MOL]
J7A  430450212  [CONN_SD-43045-005_02_MOL]
J7B  430450412  [CONN_SD-43045-005_04_MOL]
J7C  430450612  [CONN_SD-43045-005_06_MOL]
R600  2.2k  [RESC1609X50X30NL10T20]
R601  2.2k  [RESC1609X50X30NL10T20]
R602  33ohm  [FP-CRCW0603-e3-IPC_A]
R603  33 ohm  [FP-CRCW0603-e3-IPC_A]
R604  33 ohm  [FP-CRCW0603-e3-IPC_A]
R605  33 ohm  [FP-CRCW0603-e3-IPC_A]
R606  60 ohm  [FP-CRCW0603-e3-IPC_C]
R607  60ohm  [FP-CRCW0603-e3-IPC_C]
R608  60 ohm  [FP-CRCW0603-e3-IPC_C]
R609  60ohm  [FP-CRCW0603-e3-IPC_C]
TP600  5011  [KSTN-5011_V]
TP601  5011  [KSTN-5011_V]
TP602  5011  [KSTN-5011_V]
TP603  5011  [KSTN-5011_V]
TP604  5011  [KSTN-5011_V]
TP605  5011  [KSTN-5011_V]
U600  TCAN332GDR  [SOIC127P599X175-8N]
U601  TCAN332GDR  [SOIC127P599X175-8N]

### Ports
CAN_J5_RX (bidir, see [3]RootSheet[3D], STM32[5G]), CAN_J5_TX (bidir, see [3]RootSheet[3D], STM32[5G]), CAN_J6_RX (bidir, see [3]RootSheet[3D]), CAN_J6_TX (bidir, see [3]RootSheet[3D]), I2C_SCL (bidir, see [3]RootSheet[3D], SENSE_BREAK[6D]), I2C_SDA (bidir, see [3]RootSheet[3D], SENSE_BREAK[6D]), SPI_CS (in, see [3]RootSheet[3C], STM32[5F]), SPI_MISO (out, see [3]RootSheet[3D], STM32[7G]), SPI_MOSI (in, see [3]RootSheet[3C]), SPI_SCK (in, see [3]RootSheet[3D])

### Nets
+3V3_PWR: C601.2 C603.2 J7B.3 J7C.5 R600.2 R601.2 U600.3(VCC) U601.3(VCC)
GND: C600.2 C601.1 C602.2 C603.1 CR600.3(COMMONCATHODE) CR601.3(COMMONCATHODE) D600.9(GND) D601.9(GND) J7B.4 J7C.6 U600.2(GND) U601.2(GND)
CAN_H_FAIU_BAT: CR600.2(CATHODE) J1B.1 R606.1 TP602.1 U600.7(CANH)
CAN_H_FAIU_SAT: CR601.2(CATHODE) J7A.1 R608.1 TP604.1 U601.7(CANH)
CAN_L_FAIU_BAT: CR600.1(CATHODE) J1B.2 R607.1 TP603.1 U600.6(CANL)
CAN_L_FAIU_SAT: CR601.1(CATHODE) J7A.2 R609.1 TP605.1 U601.6(CANL)
I2C_SCL: D600.1 R601.1 ; port I2C_SCL
I2C_SCL_FAIU_SAT: D600.8 J7B.1 TP600.1
I2C_SDA: D600.2 R600.1 ; port I2C_SDA
I2C_SDA_FAIU_SAT: D600.7 J7B.2 TP601.1
SPI_CS_FAIU_SAT: D601.5 J7C.4
SPI_MISO_FAIU_SAT: D601.7 J7C.2
SPI_MOSI_FAIU_SAT: D601.6 J7C.3
SPI_SCK_FAIU_SAT: D601.8 J7C.1
NetC600_1: C600.1 R606.2 R607.2
NetC602_1: C602.1 R608.2 R609.2
NetD601_1: D601.1 R602.2
NetD601_2: D601.2 R603.2
NetD601_3: D601.3 R604.2
NetD601_4: D601.4 R605.2
NetR602_1: R602.1 ; port SPI_SCK
NetR603_1: R603.1 ; port SPI_MISO
NetR604_1: R604.1 ; port SPI_MOSI
NetR605_1: R605.1 ; port SPI_CS
NetU500_73: U600.4(RXD) ; port CAN_J5_RX
NetU500_74: U600.1(TXD) ; port CAN_J5_TX
NetU500_114: U601.1(TXD) ; port CAN_J6_TX
NetU500_115: U601.4(RXD) ; port CAN_J6_RX

Not connected (* = marked no-connect by the designer): D600 3* 4* 5* 6*

### Notes on the sheet
- DWG. NO.
- REV.
- SHT.
- REVISION
- DESCRIPTION
- DATE
- APPROVED
- THIS DOCUMENT AND THE DATA DISCLOSED HEREIN OR HEREWITH IS THE PROPERTY OF ALTIUM LIMITED AND MAY BE FREELY DISTRIBUTED IN WHOLE. NO RIGHTS ARE RESERVED OR EXPRESS OR IMPLIED WARANTEE GIVEN.
- ENG:
- DSN:
- APPROVALS
- PROJECT
- DOCUMENT REVISION:
- DESIGN ITEM:
- CHK:
- BOM:
- REFERENCE DOCUMENTS
- PROJECT REVISION:
- TITLE
- FAB DWG:
- PCB DWG:
- ASSY DWG:
- SCALE:
- SIZE
- C
- CAGE CODE
- FILE NAME
- DWG NO.
- SHEET
- OF
- REV

### Library data of the parts
C600-C603 = CMP-2006-02386-1: Manufacturer: Murata; Part Number: GCM188R71H472KA37D
CR600 CR601 = PESD2CAN,215: Description; Manufacturer_Name: Nexperia; Copyright: Copyright (C) 2026 Ultra Librarian. All rights reserved.; Manufacturer_Part_Number: PESD2CAN,215; RefDes: RefDes; Type: Type
D600 D601 = UCLAMP3324P.TCT: 8V Clamp 5A (8/20Âµs) Ipp Tvs Diode Surface Mount SLP2116P8 (2.1x1.6); MF: Semtech Corporation; SnapEDA_Link: https://www.snapeda.com/parts/UCLAMP3324P.TCT/Semtech/view-part/?ref=snap; Package: UFDFN-8 Semtech Corporation; Value: *; MP: UCLAMP3324P.TCT; Check_prices: https://www.snapeda.com/parts/UCLAMP3324P.TCT/Semtech/view-part/?ref=eda
J1B J7A = 430450212: Connector Header Through Hole 2 position; MF: Molex; SnapEDA_Link: https://www.snapeda.com/parts/430450212/Molex/view-part/?ref=snap; Package: None; Value: *; MP: 430450212; Check_prices: https://www.snapeda.com/parts/430450212/Molex/view-part/?ref=eda
J7B = 430450412: Conn Wire to Board HDR 4Power POS 3mm Solder ST Top Entry Thru-Hole Micro-Fit 3.0â„¢ Tray; MF: Molex; SnapEDA_Link: https://www.snapeda.com/parts/430450412/Molex/view-part/?ref=snap; Package: None; Value: *; MP: 430450412; Check_prices: https://www.snapeda.com/parts/430450412/Molex/view-part/?ref=eda
J7C = 430450612: Conn Wire to Board HDR 6 POS 3mm Solder ST Top Entry Thru-Hole Micro-Fit 3.0â„¢ Tray; MF: Molex; SnapEDA_Link: https://www.snapeda.com/parts/430450612/Molex/view-part/?ref=snap; Package: None; Value: *; MP: 430450612; Check_prices: https://www.snapeda.com/parts/430450612/Molex/view-part/?ref=eda
R600 R601 = CMP-2000-03167-1: Part Number: CRCW06032K20FKEA; Manufacturer: Vishay Dale
R602-R605 = CMP-2000-03250-2: as R501 on sheet STM32; Case/Package: 0603; Weight: 7.1E-05oz; Termination: SMD/SMT; Voltage Rating (DC): 75V; Packaging: Tape and Reel; Width: 0.85mm; Depth: 0.85mm; Mount: Surface Mount; Number of Terminations: 2; Min Operating Temperature: -55°C; Military Standard: Not; Package Quantity: 10; Contact Plating: Tin; Radiation Hardening: No; Lead Free: Lead Free; Tolerance: 1%; Power Rating: 100mW; Features: Automotive AEC-Q200; Height: 0.45mm; Case Code (Metric): 1608; Length: 1.55mm; Composition: Thick Film; Max Operating Temperature: 155°C; Temperature Coefficient: 100ppm/°C; Case Code (Imperial): 0603
R606-R609 = CMP-2000-03506-2: RES Thick Film, 60.4Ω, 1%, 0.1W, 100ppm/°C, 0603; Working Voltage: 75V; Power Rating: 100mW; Resistance: 60.4R; Package Quantity: 10; Termination: SMD/SMT; Features: Automotive AEC-Q200; Mount: Surface Mount; Min Operating Temperature: -55°C; Temperature Coefficient: 100ppm/°C; Height: 0.45mm; Max Operating Temperature: 155°C; Depth: 0.85mm; Packaging: Tape and Reel; Voltage Rating: 75V; Tolerance: 1%; Case Code (Imperial): 0603; Composition: Thick Film; Number of Terminations: 2; Weight: 7.1E-05oz; Contact Plating: Tin; Width: 0.033inch; Radiation Hardening: No; Case/Package: 0603; Case Code (Metric): 1608; Lead Free: Lead Free; Max Power Dissipation: 100mW; Length: 1.55mm; Voltage Rating (DC): 75V; Military Standard: Not
TP600-TP605 = CMP-1672-00003-4: Test Point, Black, Through Hole, RoHS, Bulk; Manufacturer: Keystone; ComponentLink2URL: http://www.keyelco.com/product-pdf.cfm?p=1320; Colour: Black; Pins: 1; REACH SVHC: No SVHC; ComponentLink1URL: http://www.keyelco.com/; PackageReference: 5011; Contact Plating: Silver; Package Quantity: 100; Packaging: Bulk; RoHSCompliant: true; Height: 8.12 mm; PackageDescription: 1-Pin Through Hole Device, Dia 3.17 mm; Mount: Through Hole; Mounting Technology: Through Hole; DatasheetVersion: Rev. F, 12/2013; ComponentLink1Description: Manufacturer URL; Contact Material: Bronze; ComponentLink2Description: Datasheet
U600 U601 = TCAN332GDR: 3.3-V CAN Transceivers with CAN FD (Flexible Data Rate); MF: Texas Instruments; SnapEDA_Link: https://www.snapeda.com/parts/TCAN332GDR/Texas+Instruments/view-part/?ref=snap; Package: SOIC-8 Texas Instruments; Value: *; MP: TCAN332GDR; Check_prices: https://www.snapeda.com/parts/TCAN332GDR/Texas+Instruments/view-part/?ref=eda

## Nets that join several sheets
+1.2V_PWR: CONN_INPUT (C104.1 R101.1 TP105.1 U100.5), ETHERNET (C300.1 C301.1 TP300.1 U300.1)
+3V3_PWR: CONN_INPUT (5 pins), ETHERNET (C308.1 FB300.2 R309.2), STM32 (36 pins), SENSE_BREAK (C401.2 R400.1 U401.6 U403.8), CONN_OUTPUT (8 pins)
+5: CONN_INPUT (8 pins), SENSE_BREAK (R401.1)
GND: CONN_INPUT (16 pins), ETHERNET (16 pins), STM32 (39 pins), SENSE_BREAK (10 pins), CONN_OUTPUT (12 pins)
I2C_SCL: STM32 (U500.140), SENSE_BREAK (U401.5 U403.2), CONN_OUTPUT (D600.1 R601.1)
I2C_SDA: STM32 (U500.139), SENSE_BREAK (U401.4 U403.1), CONN_OUTPUT (D600.2 R600.1)
JTDO_STM: CONN_INPUT (J9.4), STM32 (U500.133)
NetC100_2: CONN_INPUT (5 pins), SENSE_BREAK (U401.8 U401.10)
NetC400_2: STM32 (TP501.1 U500.40), SENSE_BREAK (C400.2 R400.2 U400.4)
NetCR100_4: CONN_INPUT (CR100.4), ETHERNET (T300.3)
NetCR100_6: CONN_INPUT (CR100.6), ETHERNET (T300.1)
NetCR101_4: CONN_INPUT (CR101.4), ETHERNET (T300.8)
NetCR101_6: CONN_INPUT (CR101.6), ETHERNET (T300.6)
NetD101_2: CONN_INPUT (D101.2 J2C.1), SENSE_BREAK (D400.2 U400.2)
NetFB100_1: CONN_INPUT (FB100.1 R100.2), SENSE_BREAK (U401.9)
NetJ9_2: CONN_INPUT (J9.2), STM32 (U500.105)
NetJ9_3: CONN_INPUT (J9.3), STM32 (U500.110)
NetJ9_5: CONN_INPUT (J9.5), STM32 (U500.109)
NetR302_1: ETHERNET (R302.1), STM32 (U500.126)
NetR304_2: ETHERNET (R304.2), STM32 (U500.44)
NetR305_1: ETHERNET (R305.1), STM32 (U500.128)
NetR306_2: ETHERNET (R306.2), STM32 (U500.45)
NetR307_1: ETHERNET (R307.1), STM32 (U500.129)
NetR308_1: ETHERNET (R308.1 U300.15), STM32 (U500.43)
NetR309_1: ETHERNET (R309.1 U300.10), STM32 (U500.36)
NetR602_1: STM32 (U500.136), CONN_OUTPUT (R602.1)
NetR603_1: STM32 (U500.42), CONN_OUTPUT (R603.1)
NetR604_1: STM32 (U500.41), CONN_OUTPUT (R604.1)
NetR605_1: STM32 (U500.123), CONN_OUTPUT (R605.1)
NetTP500_1: ETHERNET (U300.16), STM32 (TP500.1 U500.35)
NetU300_11: ETHERNET (U300.11), STM32 (U500.27)
NetU500_73: STM32 (U500.73), CONN_OUTPUT (U600.4)
NetU500_74: STM32 (U500.74), CONN_OUTPUT (U600.1)
NetU500_114: STM32 (U500.114), CONN_OUTPUT (U601.1)
NetU500_115: STM32 (U500.115), CONN_OUTPUT (U601.4)
NTJRST_STM: CONN_INPUT (J9.1), STM32 (U500.134)